# Altium schematic sheet Pico_DAC.SchDoc
size A; SheetNumber: 1; SheetTotal: 1
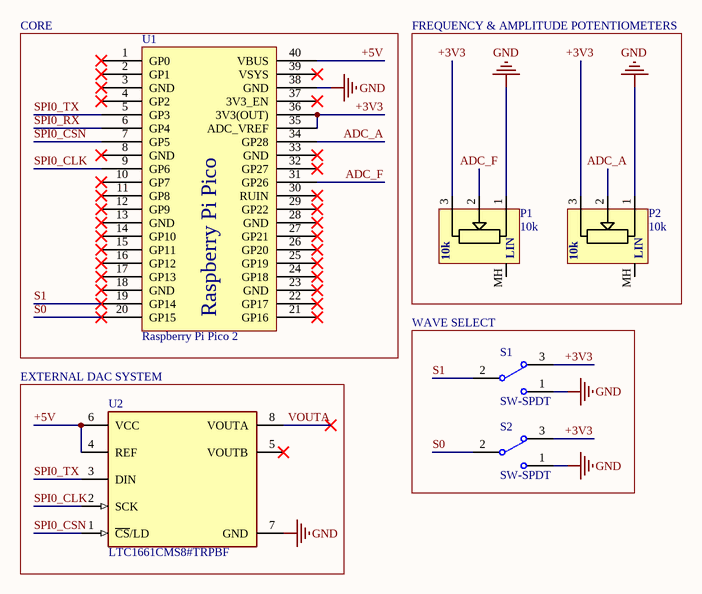
[diagram p0: Pico_DAC.SchDoc]

## Parts
P1  10k  [RK09L1140A5L]
P2  10k  [RK09L1140A5L]
S1  SW-SPDT  [SW DPST jameco]
S2  SW-SPDT  [SW DPST jameco]
U1  Raspberry Pi Pico 2  [Raspberry Pi Pico]
U2  LTC1661CMS8#TRPBF  [FP-MS8-8-05-08-1660-IPC_B]

## Blocks framed on the sheet
CORE: U1
FREQUENCY & AMPLITUDE POTENTIOMETERS: P1 P2
WAVE SELECT: S1 S2
EXTERNAL DAC SYSTEM: U2

## Nets
GND: P1.1 P2.1 S1.1 S2.1 U1.38(GND) U2.7(GND)
+3V3: P1.3 P2.3 S1.3 S2.3 U1.35(ADC_VREF) U1.36(3V3(OUT))
+5V: U1.40(VBUS) U2.4(REF) U2.6(VCC)
ADC_A: P2.2 U1.34(GP28)
ADC_F: P1.2 U1.31(GP26)
S0: S2.2 U1.20(GP15)
S1: S1.2 U1.19(GP14)
SPI0_CLK: U1.9(GP6) U2.2(SCK)
SPI0_CSN: U1.7(GP5) U2.1(~{CS}/LD)
SPI0_RX: U1.6(GP4)
SPI0_TX: U1.5(GP3) U2.3(DIN)
VOUTA: U2.8(VOUTA)

Not connected (* = marked no-connect by the designer): P1 MH; P2 MH; U1 1(GP0)* 2(GP1)* 3(GND)* 4(GP2)* 8(GND)* 10(GP7)* 11(GP8)* 12(GP9)* 13(GND)* 14(GP10)* 15(GP11)* 16(GP12)* 17(GP13)* 18(GND)* 21(GP16)* 22(GP17)* 23(GND)* 24(GP18)* 25(GP19)* 26(GP20)* 27(GP21)* 28(GND)* 29(GP22)* 30(RUIN)* 32(GP27)* 33(GND)* 37(3V3_EN)* 39(VSYS)*; U2 5(VOUTB)*

## Notes on the sheet
- (in symbol RK09L1140A5L) LIN

## Library data of the parts
P1 P2 = RK09L1140A5L: Potentiometer Vertical 10k Linear Taper (1B) THT PCB-Mount D-Type 6mm Shaft; Manufacturer: Alps Alpine; Manufacturer Part Number: RK09L1140A5L
S1 S2 = SW-SPDT: SPDT Subminiature Toggle Switch, Right Angle Mounting, Vertical Actuation; Published: 24-Mar-1999; LatestRevisionDate: 17-Dec-2003; LatestRevisionNote: Schematic revised, PCB Footprint replaced.; DatasheetVersion: 05-Dec-2000; PackageReference: TL36WW15050; Publisher: Altium Limited; PackageDescription: Switch; 4 Leads; ComponentLink1Description: Manufacturer Link; ComponentLink1URL: http://www.apem.com
U1 = Raspberry Pi Pico
U2 = CMP-09082-000102-1: IC DAC 10BIT V-OUT 8MSOP; Output Type: Voltage; Min Supply Voltage: 2.7V; Interface: Serial; Integral Nonlinearity (INL): 2LSB; Resolution: 10b; Max Supply Voltage: 5.5V; Number of Bits: 10; Supply Type: Single; Settling Time: 30us; Number of Converters: 2; Min Operating Temperature: 0°C; Lead Free: Lead Free; Number of Pins: 8; Packaging: Tape and Reel; Mount: Surface Mount; Max Operating Temperature: 70°C; Package Quantity: 2500; Number of Channels: 2; Case/Package: MSOP